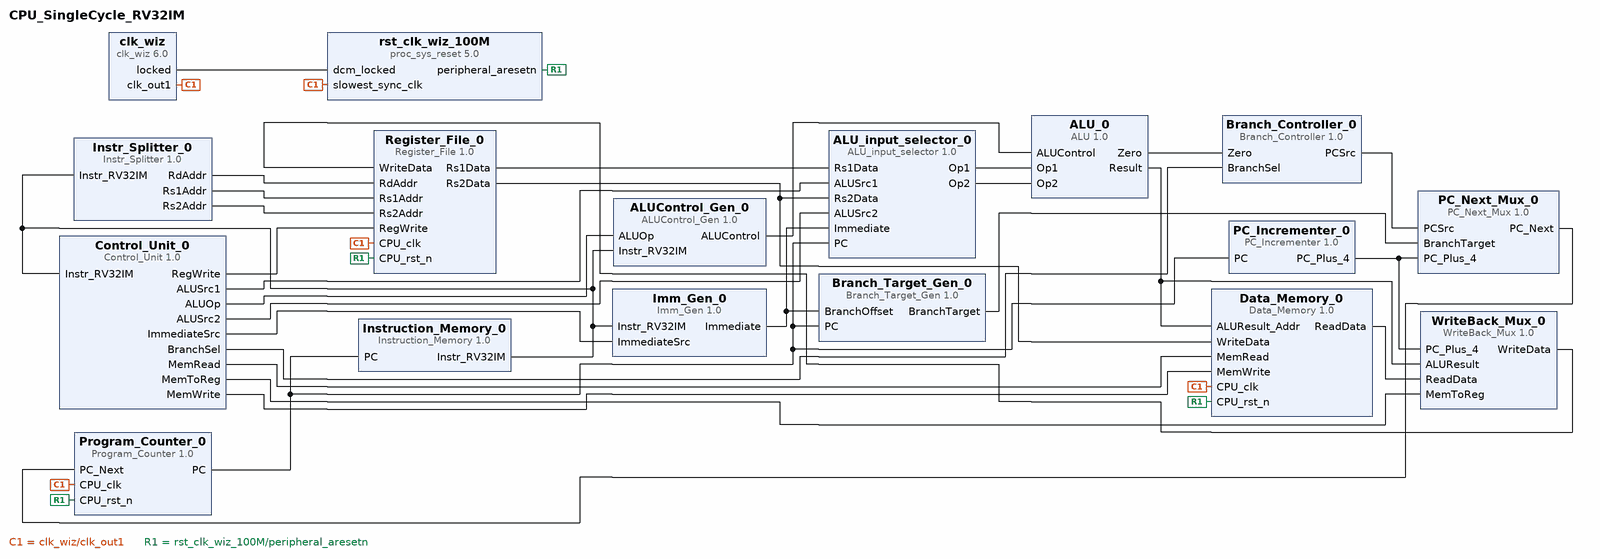
[diagram p0: block diagram of the top level]
# Vivado block design CPU_SingleCycle_RV32IM, xc7a200tifbg676-1L, Vivado 2024.2
create_bd_design CPU_SingleCycle_RV32IM

create_bd_cell -type ip -vlnv user.org:user:ALU:1.0 ALU_0
create_bd_cell -type ip -vlnv user.org:user:ALU_input_selector:1.0 ALU_input_selector_0
create_bd_cell -type ip -vlnv user.org:user:ALUControl_Gen:1.0 ALUControl_Gen_0
create_bd_cell -type ip -vlnv user.org:user:Register_File:1.0 Register_File_0
create_bd_cell -type ip -vlnv user.org:user:Imm_Gen:1.0 Imm_Gen_0
create_bd_cell -type ip -vlnv user.org:user:Control_Unit:1.0 Control_Unit_0
create_bd_cell -type ip -vlnv user.org:user:Instruction_Memory:1.0 Instruction_Memory_0
create_bd_cell -type ip -vlnv user.org:user:Program_Counter:1.0 Program_Counter_0
create_bd_cell -type ip -vlnv user.org:user:Data_Memory:1.0 Data_Memory_0
create_bd_cell -type ip -vlnv user.org:user:WriteBack_Mux:1.0 WriteBack_Mux_0
create_bd_cell -type ip -vlnv user.org:user:PC_Next_Mux:1.0 PC_Next_Mux_0
create_bd_cell -type ip -vlnv user.org:user:Branch_Target_Gen:1.0 Branch_Target_Gen_0
create_bd_cell -type ip -vlnv user.org:user:PC_Incrementer:1.0 PC_Incrementer_0
create_bd_cell -type ip -vlnv xilinx.com:ip:clk_wiz:6.0 clk_wiz
set_property -dict {CONFIG.CLKOUT1_REQUESTED_OUT_FREQ 100.0} [get_bd_cells clk_wiz]
create_bd_cell -type ip -vlnv xilinx.com:ip:proc_sys_reset:5.0 rst_clk_wiz_100M
create_bd_cell -type ip -vlnv user.org:user:Branch_Controller:1.0 Branch_Controller_0
create_bd_cell -type ip -vlnv user.org:user:Instr_Splitter:1.0 Instr_Splitter_0

# ---- connections ----

connect_bd_net [get_bd_pins ALUControl_Gen_0/ALUControl] [get_bd_pins ALU_0/ALUControl]
connect_bd_net [get_bd_pins ALU_0/Result] [get_bd_pins Data_Memory_0/ALUResult_Addr] [get_bd_pins WriteBack_Mux_0/ALUResult]
connect_bd_net [get_bd_pins ALU_0/Zero] [get_bd_pins Branch_Controller_0/Zero]
connect_bd_net [get_bd_pins ALU_input_selector_0/Op1] [get_bd_pins ALU_0/Op1]
connect_bd_net [get_bd_pins ALU_input_selector_0/Op2] [get_bd_pins ALU_0/Op2]
connect_bd_net [get_bd_pins Branch_Controller_0/PCSrc] [get_bd_pins PC_Next_Mux_0/PCSrc]
connect_bd_net [get_bd_pins Branch_Target_Gen_0/BranchTarget] [get_bd_pins PC_Next_Mux_0/BranchTarget]
connect_bd_net [get_bd_pins Control_Unit_0/ALUOp] [get_bd_pins ALUControl_Gen_0/ALUOp]
connect_bd_net [get_bd_pins Control_Unit_0/ALUSrc1] [get_bd_pins ALU_input_selector_0/ALUSrc1]
connect_bd_net [get_bd_pins Control_Unit_0/ALUSrc2] [get_bd_pins ALU_input_selector_0/ALUSrc2]
connect_bd_net [get_bd_pins Control_Unit_0/BranchSel] [get_bd_pins Branch_Controller_0/BranchSel]
connect_bd_net [get_bd_pins Control_Unit_0/ImmediateSrc] [get_bd_pins Imm_Gen_0/ImmediateSrc]
connect_bd_net [get_bd_pins Control_Unit_0/MemRead] [get_bd_pins Data_Memory_0/MemRead]
connect_bd_net [get_bd_pins Control_Unit_0/MemToReg] [get_bd_pins WriteBack_Mux_0/MemToReg]
connect_bd_net [get_bd_pins Control_Unit_0/MemWrite] [get_bd_pins Data_Memory_0/MemWrite]
connect_bd_net [get_bd_pins Control_Unit_0/RegWrite] [get_bd_pins Register_File_0/RegWrite]
connect_bd_net [get_bd_pins Data_Memory_0/ReadData] [get_bd_pins WriteBack_Mux_0/ReadData]
connect_bd_net [get_bd_pins Imm_Gen_0/Immediate] [get_bd_pins ALU_input_selector_0/Immediate] [get_bd_pins Branch_Target_Gen_0/BranchOffset]
connect_bd_net [get_bd_pins Instr_Splitter_0/RdAddr] [get_bd_pins Register_File_0/RdAddr]
connect_bd_net [get_bd_pins Instr_Splitter_0/Rs1Addr] [get_bd_pins Register_File_0/Rs1Addr]
connect_bd_net [get_bd_pins Instr_Splitter_0/Rs2Addr] [get_bd_pins Register_File_0/Rs2Addr]
connect_bd_net [get_bd_pins Instruction_Memory_0/Instr_RV32IM] \
  [get_bd_pins ALUControl_Gen_0/Instr_RV32IM] [get_bd_pins Imm_Gen_0/Instr_RV32IM] [get_bd_pins Control_Unit_0/Instr_RV32IM] \
  [get_bd_pins Instr_Splitter_0/Instr_RV32IM]
connect_bd_net -net PC_Incrementer_1_PC_Plus_4 [get_bd_pins PC_Incrementer_0/PC_Plus_4] \
  [get_bd_pins PC_Next_Mux_0/PC_Plus_4] [get_bd_pins WriteBack_Mux_0/PC_Plus_4]
connect_bd_net [get_bd_pins PC_Next_Mux_0/PC_Next] [get_bd_pins Program_Counter_0/PC_Next]
connect_bd_net [get_bd_pins Program_Counter_0/PC] \
  [get_bd_pins Instruction_Memory_0/PC] [get_bd_pins ALU_input_selector_0/PC] [get_bd_pins PC_Incrementer_0/PC] \
  [get_bd_pins Branch_Target_Gen_0/PC]
connect_bd_net [get_bd_pins Register_File_0/Rs1Data] [get_bd_pins ALU_input_selector_0/Rs1Data]
connect_bd_net [get_bd_pins Register_File_0/Rs2Data] [get_bd_pins ALU_input_selector_0/Rs2Data] [get_bd_pins Data_Memory_0/WriteData]
connect_bd_net [get_bd_pins WriteBack_Mux_0/WriteData] [get_bd_pins Register_File_0/WriteData]
connect_bd_net [get_bd_pins clk_wiz/clk_out1] \
  [get_bd_pins Data_Memory_0/CPU_clk] [get_bd_pins rst_clk_wiz_100M/slowest_sync_clk] [get_bd_pins Program_Counter_0/CPU_clk] \
  [get_bd_pins Register_File_0/CPU_clk]
connect_bd_net [get_bd_pins clk_wiz/locked] [get_bd_pins rst_clk_wiz_100M/dcm_locked]
connect_bd_net [get_bd_pins rst_clk_wiz_100M/peripheral_aresetn] \
  [get_bd_pins Data_Memory_0/CPU_rst_n] [get_bd_pins Program_Counter_0/CPU_rst_n] [get_bd_pins Register_File_0/CPU_rst_n]

validate_bd_design
save_bd_design
